# Altium schematic sheet Power_Sheet.SchDoc
size 420 x 297 mm; SheetNumber: 3; SheetTotal: 12
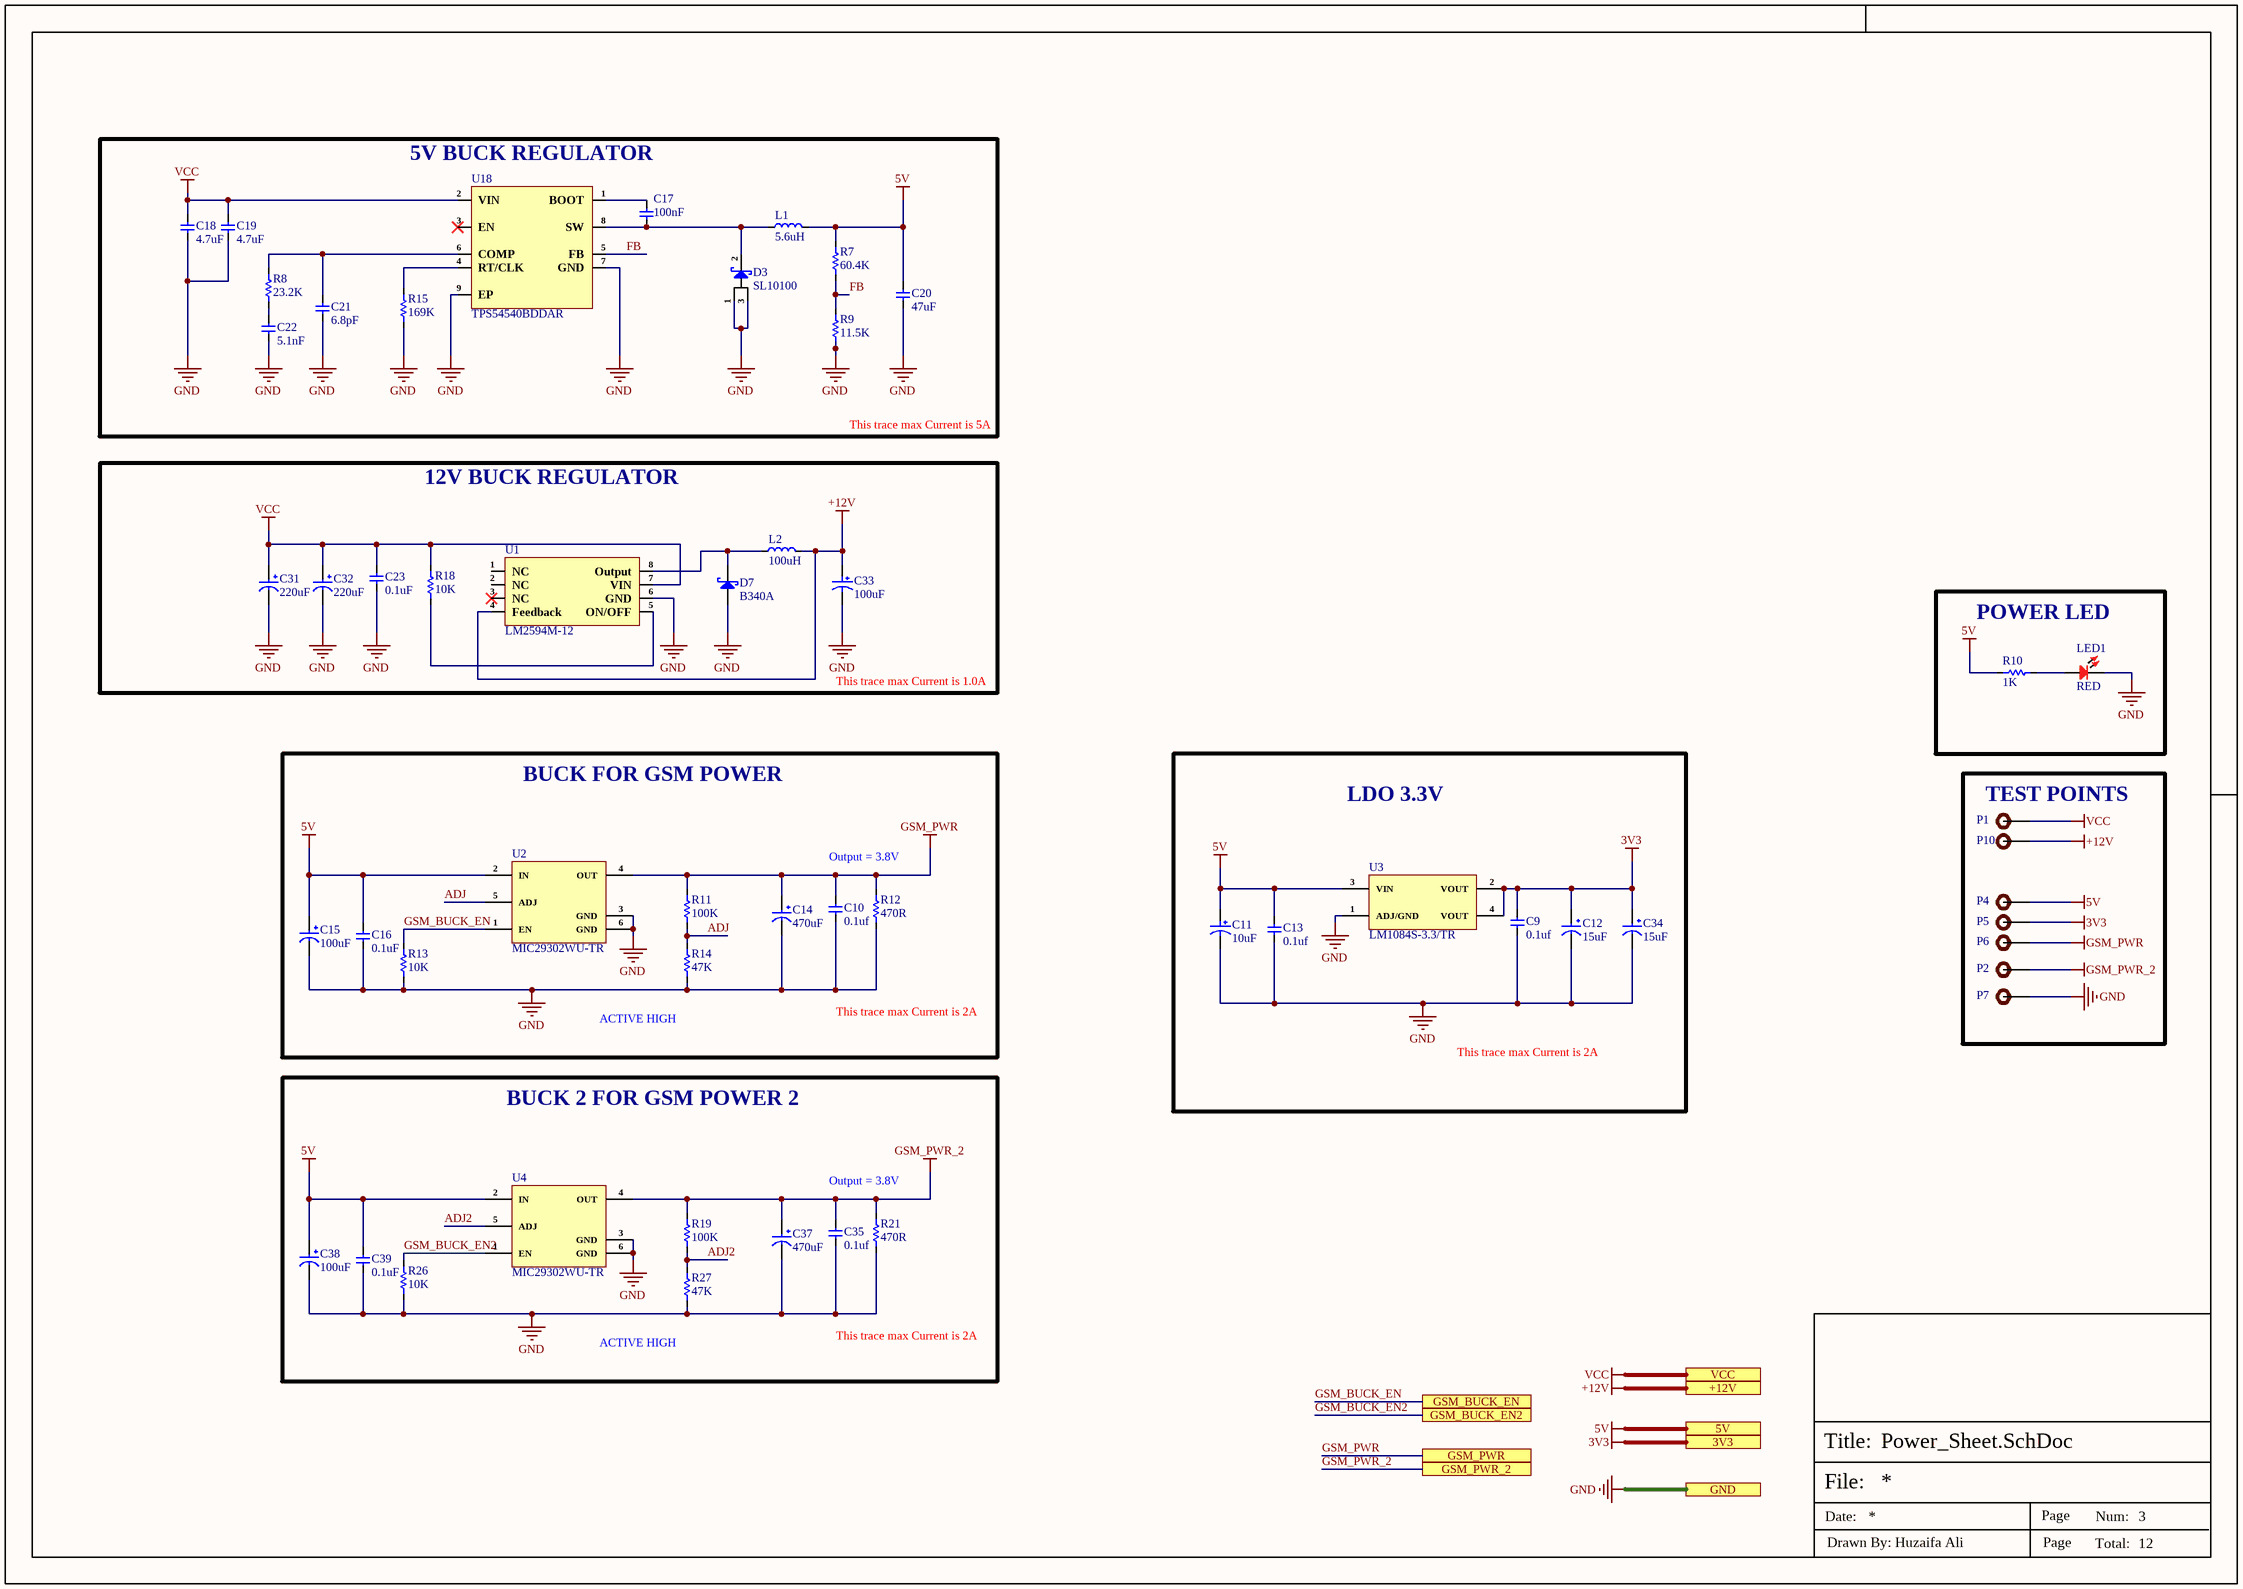
[diagram p0: Power_Sheet.SchDoc]

## Parts
C9  0.1uf  [Cap-0402]
C10  0.1uf  [Cap-0402]
C11  10uF  [Case-B]
C12  15uF  [Case-D]
C13  0.1uf  [Cap-0402]
C14  470uF  [Case-E]
C15  100uF  [Case-B]
C16  0.1uF  [Cap-0603]
C17  100nF  [Cap-0402]
C18  4.7uF  [Cap-1206]
C19  4.7uF  [Cap-1206]
C20  47uF  [Cap-1206]
C21  6.8pF  [Cap-0402]
C22  5.1nF  [Res-0603]
C23  0.1uF  [Cap-0603]
C31  220uF  [UCD-220uF-10mmDia]
C32  220uF  [UCD-220uF-10mmDia]
C33  100uF  [RVT1H101M0607]
C34  15uF  [Case-D]
C35  0.1uf  [Cap-0402]
C37  470uF  [Case-E]
C38  100uF  [Case-B]
C39  0.1uF  [Cap-0603]
D3  SL10100  [TO-277]
D7  B340A  [SMA(DO-214AC)]
L1  5.6uH  [FXL0630-5R6-M]
L2  100uH  [TMPA1265SP-101MN-D]
LED1  RED  [LED-0603]
P1  TEST POINT  [Test-point]  (value not drawn)  (no BOM)
P2  TEST POINT  [Test-point]  (value not drawn)  (no BOM)
P4  TEST POINT  [Test-point]  (value not drawn)  (no BOM)
P5  TEST POINT  [Test-point]  (value not drawn)  (no BOM)
P6  TEST POINT  [Test-point]  (value not drawn)  (no BOM)
P7  TEST POINT  [Test-point]  (value not drawn)  (no BOM)
P10  TEST POINT  [Test-point]  (value not drawn)  (no BOM)
R7  60.4K  [Res-0402]
R8  23.2K  [Res-0402]
R9  11.5K  [Res-0402]
R10  1K  [Res-0201]
R11  100K  [Res-0201]
R12  470R  [Res-0201]
R13  10K  [Res-0201]
R14  47K  [Res-0402]
R15  169K  [Res-0402]
R18  10K  [Res-0201]
R19  100K  [Res-0201]
R21  470R  [Res-0201]
R26  10K  [Res-0201]
R27  47K  [Res-0402]
U1  LM2594M-12  [SOP-8]
U2  MIC29302WU-TR  [TO-263-5 (D2PAK)]
U3  LM1084S-3.3/TR  [TO263-3_]
U4  MIC29302WU-TR  [TO-263-5 (D2PAK)]
U18  TPS54540BDDAR  [8-SO PowerPad]

## Blocks framed on the sheet
5V BUCK REGULATOR: C17-C22 D3 L1 R7-R9 R15 U18
12V BUCK REGULATOR: C23 C31-C33 D7 L2 R18 U1
POWER LED: LED1 R10
BUCK FOR GSM POWER: C10 C14-C16 R11-R14 U2
LDO 3.3V: C9 C11-C13 C34 U3
TEST POINTS: P1 P2 P4-P7 P10
BUCK 2 FOR GSM POWER 2: C35 C37-C39 R19 R21 R26 R27 U4

## Ports
3V3, 5V, +12V, GND, GSM_BUCK_EN, GSM_BUCK_EN2, GSM_PWR, GSM_PWR_2, VCC

## Nets
3V3: C9.2 C12.1 C34.1 P5.1 U3.2(VOUT) U3.4(VOUT) ; port 3V3
5V: C11.1 C13.2 C15.1 C16.2 C20.2 C38.1 C39.2 L1.2 P4.1 R7.2 R10.1 U2.2(IN) U3.3(VIN) U4.2(IN) ; port 5V
+12V: C33.1 L2.2 P10.1 U1.4(Feedback) ; port +12V
GND: C9.1 C10.1 C11.2 C12.2 C13.1 C14.2 C15.2 C16.1 C18.1 C19.1 C20.1 C21.1 C22.1 C23.1 C31.2 C32.2 C33.2 C34.2 C35.1 C37.2 C38.2 C39.1 D3.1(A) D3.3(A) D7.2(A) LED1.2 P7.1 R9.1 R12.1 R13.1 R14.1 R15.1 R21.1 R26.1 R27.1 U1.6(GND) U2.3(GND) U2.6(GND) U3.1(ADJ/GND) U4.3(GND) U4.6(GND) U18.7(GND) U18.9(EP) ; port GND
GSM_PWR: C10.2 C14.1 P6.1 R11.2 R12.2 U2.4(OUT) ; port GSM_PWR
GSM_PWR_2: C35.2 C37.1 P2.1 R19.2 R21.2 U4.4(OUT) ; port GSM_PWR_2
VCC: C18.2 C19.2 C23.2 C31.1 C32.1 P1.1 R18.2 U1.7(VIN) U18.2(VIN) ; port VCC
ADJ: R11.1 R14.2 U2.5(ADJ)
ADJ2: R19.1 R27.2 U4.5(ADJ)
FB: R7.1 R9.2 U18.5(FB)
GSM_BUCK_EN: R13.2 U2.1(EN) ; port GSM_BUCK_EN
GSM_BUCK_EN2: R26.2 U4.1(EN) ; port GSM_BUCK_EN2
NetC17_1: C17.1 D3.2(K) L1.1 U18.8(SW)
NetC17_2: C17.2 U18.1(BOOT)
NetC21_2: C21.2 R8.2 U18.6(COMP)
NetC22_2: C22.2 R8.1
NetD7_1: D7.1(K) L2.1 U1.8(Output)
NetLED1_1: LED1.1 R10.2
NetR15_2: R15.2 U18.4(RT/CLK)
NetR18_1: R18.1 U1.5(ON/OFF)

Not connected (* = marked no-connect by the designer): U1 1(NC) 2(NC) 3(NC)*; U18 3(EN)*

## Notes on the sheet
- This trace max Current is 5A
- This trace max Current is 1.0A
- Output = 3.8V
- (near R14) ACTIVE HIGH
- This trace max Current is 2A
- (near R27) ACTIVE HIGH
- File:
- Title:
- Date:
- Page
- Num:
- Total:
- Drawn By: Huzaifa Ali

## Library data of the parts
C9 C10 C13 C35 = GRM155R62A104KE14D: CAP CER 0.1UF 100V X5R 0402; Manufacturer: Murata; Capacitance: 100nF; Tolerance: 10%; Item Type: Capacitor; Supplier 1: Arrow Electronics; Manufacturer Part Number: GRM155R62A104KE14D; RoHS: Yes; Category: Ceramic Capacitors; Stock 1: 870000; Pricing 1: 10000=0.00500, 20000=0.00410, 30000=0.00390, 50000=0.00370, 100000=0.00300 (USD); Mount: Surface Mount; Case/Package: 0402; Case Code (Metric): 1005; Case Code (Imperial): 0402; Weight: 0.000212oz; Min Operating Temperature: -55°C; Max Operating Temperature: 85°C; Packaging: Tape and Reel; Voltage Rating: 100V; Dielectric: X5R; Termination: SMD/SMT; Voltage Rating (DC): 100V; Package Quantity: 10000; Series: GRM; Length: 0.039inch; Width: 0.02inch; Height: 0.5mm; Thickness: 0.022inch; Reach SVHC Compliant: Yes; Lead Free: Lead Free; RoHS Compliant: Yes; ComponentLink1URL: http://www.farnell.com/datasheets/2079151.pdf?src-supplier=Farnell; ComponentLink1Description: http://www.farnell.com/datasheets/2079151.pdf?src-supplier=Farnell; ComponentLink2URL: http://www.mouser.com/ds/2/281/c02e-2905.pdf?src-supplier=Mouser; ComponentLink2Description: http://www.mouser.com/ds/2/281/c02e-2905.pdf?src-supplier=Mouser; ComponentLink3URL: http://www.farnell.com/datasheets/2079151.pdf?src-supplier=Element14; ComponentLink3Description: http://www.farnell.com/datasheets/2079151.pdf?src-supplier=Element14; ComponentLink4URL: http://search.murata.co.jp/Ceramy/image/img/A01X/G101/ENG/GRM155R62A104KE14-01.pdf?src-supplier=Digi-Key; ComponentLink4Description: http://search.murata.co.jp/Ceramy/image/img/A01X/G101/ENG/GRM155R62A104KE14-01.pdf?src-supplier=Digi-Key; ComponentLink5URL: http://www.farnell.com/datasheets/2079151.pdf?src-supplier=Newark; ComponentLink5Description: http://www.farnell.com/datasheets/2079151.pdf?src-supplier=Newark; Supplier Part Number 1: GRM155R62A104KE14D; LCSC Part Number: C162178
C11 = CA45-B025K106T: 10uF 25V 2.5Ω@100kHz ±10% CASE-B-3528 Tantalum Capacitors ROHS; Manufacturer: Xiangyee in S&T; Manufacturer Part Number: CA45-B025K106T; ComponentLink1URL: https://www.lcsc.com/product-detail/Tantalum-Capacitors_Hunan-Xiangyee-in-S-T-CA45-B025K106T_C119050.html; ComponentLink1Description: LCSC; LCSC Part Number: C119050; Item Type: Capacitor; Package: Case-B
C12 C34 = TAJD156K050RNJ: CAP TANT 15UF 10% 50V 2917; Manufacturer: Kyocera AVX; Dielectric Material: Tantalum; ESR (Equivalent Series Resistance): 600mR; Leakage Current: 7.5uA; Dissipation Factor: 6%; Item Type: Capacitor; Supplier 1: Rs; Manufacturer Part Number: TAJD156K050RNJ; RoHS: Yes; Category: Tantalum Capacitors; Stock 1: 712; Pricing 1: 500=1.59 (GBP); Mounting Technology: Surface Mount; Case/Package: 2917; Case Code (Metric): 7343; Case Code (Imperial): 2917; Min Operating Temperature: -55°C; Max Operating Temperature: 125°C; Value: 15uF; Tolerance: 10%; Voltage Rating: 50V; Packaging: Tape and Reel; Package Quantity: 500; Termination: SMD/SMT; Features: General Purpose; Series: TAJ; Construction: Flat; Length: 7.3mm; Width: 4.3mm; Height: 3.1mm; Height - Seated (Max): 0.122inch; Depth: 4.3mm; Lead Pitch: 4.4mm; Radiation Hardening: No; Reach SVHC Compliant: No; Lead Free: Lead Free; RoHS Compliant: Yes; ComponentLink1URL: https://datasheet.ciiva.com/7914/1680476-7914621.pdf?src-supplier=Element14; ComponentLink1Description: https://datasheet.ciiva.com/7914/1680476-7914621.pdf?src-supplier=Element14; ComponentLink2URL: https://datasheet.ciiva.com/7914/1680476-7914620.pdf?src-supplier=Element14; ComponentLink2Description: https://datasheet.ciiva.com/7914/1680476-7914620.pdf?src-supplier=Element14; ComponentLink3URL: https://datasheet.ciiva.com/7914/1826076-7914622.pdf?src-supplier=Element14; ComponentLink3Description: https://datasheet.ciiva.com/7914/1826076-7914622.pdf?src-supplier=Element14; ComponentLink4URL: https://datasheet.ciiva.com/29500/taj-29500328.pdf?src-supplier=Digi-Key; ComponentLink4Description: https://datasheet.ciiva.com/29500/taj-29500328.pdf?src-supplier=Digi-Key; ComponentLink5URL: https://datasheet.ciiva.com/29500/taj-29500327.pdf?src-supplier=Digi-Key; ComponentLink5Description: https://datasheet.ciiva.com/29500/taj-29500327.pdf?src-supplier=Digi-Key; ComponentLink6URL: https://datasheet.ciiva.com/29500/taj-29500329.pdf?src-supplier=Digi-Key; ComponentLink6Description: https://datasheet.ciiva.com/29500/taj-29500329.pdf?src-supplier=Digi-Key; ComponentLink7URL: https://datasheet.ciiva.com/12884/taj-27497-12884462.pdf?src-supplier=Mouser; ComponentLink7Description: https://datasheet.ciiva.com/12884/taj-27497-12884462.pdf?src-supplier=Mouser; ComponentLink8URL: https://datasheet.ciiva.com/11229/taj-11229647.pdf?src-supplier=Avnet; ComponentLink8Description: https://datasheet.ciiva.com/11229/taj-11229647.pdf?src-supplier=Avnet; ComponentLink9URL: https://datasheet.ciiva.com/16492/taj-16492939.pdf?src-supplier=Future+Electronics; ComponentLink9Description: https://datasheet.ciiva.com/16492/taj-16492939.pdf?src-supplier=Future+Electronics; Supplier Part Number 1: 1360323; LCSC Part Number: C308932
C14 C37 = TAJE477K010RNJ: CAP TANT 470UF 10% 10V 2917; Manufacturer: Kyocera AVX; Dielectric Material: Tantalum; ESR (Equivalent Series Resistance): 500mR; Leakage Current: 47uA; Polarity: Polar; Item Type: Capacitor; Supplier 1: Arrow Electronics; Manufacturer Part Number: TAJE477K010RNJ; RoHS: Yes; Category: Tantalum Capacitors; Stock 1: 5; Pricing 1: 1=1.3181 (USD); Mounting Technology: Surface Mount,PCB; Case/Package: 2917; Pins: 2; Case Code (Imperial): 2917; Case Code (Metric): 7343; Min Operating Temperature: -55°C; Max Operating Temperature: 125°C; Value: 470uF; Tolerance: 10%; Packaging: Tape and Reel; Voltage Rating: 10V; Voltage Rating (DC): 10V; Package Quantity: 400; Termination: SMD/SMT; Voltage: 10V; Dissipation Factor: 10%; Features: General Purpose; Series: TAJ; Construction: Flat; Length: 7.3mm; Width: 4.3mm; Height: 4.1mm; Depth: 4.3mm; Lead Pitch: 4.4mm; Radiation Hardening: No; Reach SVHC Compliant: No; Lead Free: Lead Free; RoHS Compliant: Yes; ComponentLink1URL: https://datasheet.ciiva.com/7832/taj-7832508.pdf?src-supplier=Element14; ComponentLink1Description: https://datasheet.ciiva.com/7832/taj-7832508.pdf?src-supplier=Element14; ComponentLink2URL: https://datasheet.ciiva.com/7832/taj-7832507.pdf?src-supplier=Element14; ComponentLink2Description: https://datasheet.ciiva.com/7832/taj-7832507.pdf?src-supplier=Element14; ComponentLink3URL: https://datasheet.ciiva.com/265/taj-265547.pdf?src-supplier=Digi-Key; ComponentLink3Description: https://datasheet.ciiva.com/265/taj-265547.pdf?src-supplier=Digi-Key; ComponentLink4URL: https://datasheet.ciiva.com/265/taj-265546.pdf?src-supplier=Digi-Key; ComponentLink4Description: https://datasheet.ciiva.com/265/taj-265546.pdf?src-supplier=Digi-Key; ComponentLink5URL: https://datasheet.ciiva.com/265/taj-265548.pdf?src-supplier=Digi-Key; ComponentLink5Description: https://datasheet.ciiva.com/265/taj-265548.pdf?src-supplier=Digi-Key; ComponentLink6URL: https://datasheet.ciiva.com/12882/taj-27497-12882504.pdf?src-supplier=Mouser; ComponentLink6Description: https://datasheet.ciiva.com/12882/taj-27497-12882504.pdf?src-supplier=Mouser; ComponentLink7URL: https://datasheet.ciiva.com/14602/70001050-14602312.pdf?src-supplier=Allied+Electronics; ComponentLink7Description: https://datasheet.ciiva.com/14602/70001050-14602312.pdf?src-supplier=Allied+Electronics; ComponentLink8URL: https://datasheet.ciiva.com/14600/70001050-14600301.pdf?src-supplier=Allied+Electronics; ComponentLink8Description: https://datasheet.ciiva.com/14600/70001050-14600301.pdf?src-supplier=Allied+Electronics; ComponentLink9URL: https://datasheet.ciiva.com/11229/taj-11229470.pdf?src-supplier=Avnet; ComponentLink9Description: https://datasheet.ciiva.com/11229/taj-11229470.pdf?src-supplier=Avnet; ComponentLink10URL: https://datasheet.ciiva.com/16330/taj-16330918.pdf?src-supplier=Future+Electronics; ComponentLink10Description: https://datasheet.ciiva.com/16330/taj-16330918.pdf?src-supplier=Future+Electronics; Supplier Part Number 1: TAJE477K010RNJ; LCSC Part Number: C7234
C15 C38 = TAJB107M010RNJ: CAP TANT 100UF 20% 10V 1411; Manufacturer: Kyocera AVX; Dielectric Material: Tantalum; Tolerance: 10%; ESR (Equivalent Series Resistance): 1.4R; Leakage Current: 10uA; Dissipation Factor: 8%; Item Type: Capacitor; Supplier 1: Rs; Manufacturer Part Number: TAJB107M010RNJ; RoHS: Yes; Category: Tantalum Capacitors; Stock 1: 17520; Pricing 1: 2000=0.302 (GBP); Mounting Technology: Surface Mount; Case/Package: 1210; Case Code (Imperial): 1210; Case Code (Metric): 3528; Min Operating Temperature: -55°C; Max Operating Temperature: 125°C; Value: 100uF; Voltage Rating (DC): 10V; Series: TAJ; Construction: Flat; Voltage Rating: 10V; Package Quantity: 2000; Packaging: Tape and Reel; Termination: SMD/SMT; Voltage: 10V; Features: General Purpose; Length: 3.5mm; Width: 2.8mm; Height: 2.1mm; Depth: 2.8mm; Radiation Hardening: No; Lead Free: Lead Free; RoHS Compliant: Yes; Reach SVHC Compliant: No; ComponentLink1URL: https://datasheet.ciiva.com/264/taj-264281.pdf?src-supplier=Digi-Key; ComponentLink1Description: https://datasheet.ciiva.com/264/taj-264281.pdf?src-supplier=Digi-Key; ComponentLink2URL: https://datasheet.ciiva.com/264/taj-264280.pdf?src-supplier=Digi-Key; ComponentLink2Description: https://datasheet.ciiva.com/264/taj-264280.pdf?src-supplier=Digi-Key; ComponentLink3URL: https://datasheet.ciiva.com/264/taj-264282.pdf?src-supplier=Digi-Key; ComponentLink3Description: https://datasheet.ciiva.com/264/taj-264282.pdf?src-supplier=Digi-Key; ComponentLink4URL: https://datasheet.ciiva.com/11225/taj-11225964.pdf?src-supplier=Avnet; ComponentLink4Description: https://datasheet.ciiva.com/11225/taj-11225964.pdf?src-supplier=Avnet; ComponentLink5URL: https://datasheet.ciiva.com/11225/taj-11225963.pdf?src-supplier=Avnet; ComponentLink5Description: https://datasheet.ciiva.com/11225/taj-11225963.pdf?src-supplier=Avnet; Supplier Part Number 1: 1354069; LCSC Part Number: C7196
C16 C23 C39 = CC0603KRX7R0BB104: CAP CER 0.1UF 100V X7R 0603; Manufacturer: Yageo; Capacitance: 100nF; Tolerance: 10%; Item Type: Capacitor; Supplier 1: Digi-Key; Manufacturer Part Number: CC0603KRX7R0BB104; RoHS: Yes; Category: Ceramic Capacitors; Stock 1: 60476; Pricing 1: 1=0.19000, 10=0.13500, 50=0.07680, 100=0.06370, 500=0.04466, 1000=0.03696 (USD); Mount: Surface Mount; Case/Package: 0603; Case Code (Metric): 1608; Case Code (Imperial): 0603; Weight: 7.1E-05oz; Min Operating Temperature: -55°C; Max Operating Temperature: 125°C; Package Quantity: 4000; Voltage Rating: 100V; Packaging: Tape and Reel; Dielectric: X7R; Termination: SMD/SMT; Resistor Type: Ceramic; Voltage Rating (DC): 100V; Series: CC; Length: 0.063inch; Width: 0.031inch; Thickness: 0.035inch; Depth: 0.8mm; Lead Free: Lead Free; RoHS Compliant: Yes; ComponentLink1URL: https://datasheet.ciiva.com/6277/mlccorderingcode-6277030.pdf?src-supplier=Digi-Key; ComponentLink1Description: https://datasheet.ciiva.com/6277/mlccorderingcode-6277030.pdf?src-supplier=Digi-Key; ComponentLink2URL: https://datasheet.ciiva.com/6277/mlccorderingcode-6277081.pdf?src-supplier=Digi-Key; ComponentLink2Description: https://datasheet.ciiva.com/6277/mlccorderingcode-6277081.pdf?src-supplier=Digi-Key; ComponentLink3URL: https://datasheet.ciiva.com/6277/mlccorderingcode-6277082.pdf?src-supplier=Digi-Key; ComponentLink3Description: https://datasheet.ciiva.com/6277/mlccorderingcode-6277082.pdf?src-supplier=Digi-Key; Supplier Part Number 1: 311-1523-1-ND; LCSC Part Number: C113803
C17 = CC0402JRX7R9BB104: CAP 0402 50V 100 NF X7R; Manufacturer: Yageo; Dielectric: 1511DielectricType; Item Type: Capacitor; Supplier: Digi-Key; Supplier Part Number: 13-CC0402JRX7R9BB104TR-ND; Manufacturer Part Number: CC0402JRX7R9BB104; RoHS: No; Category: Ceramic Capacitors; Pricing: 10000=0.0157 (USD); Case/Package: 343Case; Value: 100nF; Voltage Rating (DC): 50V; Lead Free: 5697LeadFree; LCSC Part Number: C5182432
C18 C19 = GRM31CC72A475KE11L: CAP CER 4.7UF 100V X7S 1206; Manufacturer: Murata; Item Type: Capacitor; Supplier 1: Arrow Electronics; Manufacturer Part Number: GRM31CC72A475KE11L; RoHS: Yes; Category: Ceramic Capacitors; Stock 1: 120000; Pricing 1: 2000=0.23470, 4000=0.21710, 10000=0.21040, 14000=0.20560 (USD); RoHS Compliant: Yes; ComponentLink1URL: https://search.murata.co.jp/Ceramy/image/img/A01X/G101/ENG/GRM31CC72A475KE11-01A.pdf?src-supplier=Digi-Key; ComponentLink1Description: https://search.murata.co.jp/Ceramy/image/img/A01X/G101/ENG/GRM31CC72A475KE11-01A.pdf?src-supplier=Digi-Key; Supplier Part Number 1: GRM31CC72A475KE11L; LCSC Part Number: C237304
C20 = GRM31CR61E476ME44L: CAP CER 47UF 25V X5R 1206; Manufacturer: Murata; Tolerance: 20%; Item Type: Capacitor; Supplier 1: Digi-Key; Manufacturer Part Number: GRM31CR61E476ME44L; RoHS: Yes; Category: Ceramic Capacitors; Capacitance: 47uF; Voltage Rating (DC): 25V; Dielectric: X5R; Length: 3.2mm; Width: 1.6mm; Thickness: 1.6mm; ComponentLink1URL: https://search.murata.co.jp/Ceramy/image/img/A01X/partnumbering_e_01.pdf?src-supplier=Digi-Key; ComponentLink1Description: https://search.murata.co.jp/Ceramy/image/img/A01X/partnumbering_e_01.pdf?src-supplier=Digi-Key; Supplier Part Number 1: 490-16268-2-ND; LCSC Part Number: C403725
C21 = CC0402CRNPO9BN6R8: CAP CER 6.8PF 50V C0G/NPO 0402; Manufacturer: Yageo; Dielectric: C0G; Tolerance: 2%; Insulation Resistance: 10GR; Item Type: Capacitor; Supplier: Future Electronics; Supplier Part Number: 3247368; Manufacturer Part Number: CC0402CRNPO9BN6R8; RoHS: Yes; Category: Ceramic Capacitors; Stock: 200000; Pricing: 10000=0.0024, 40000=0.0022, 150000=0.0021, 400000=0.002, 1000000=0.0019 (USD); Mounting Technology: Surface Mount; Case/Package: 0402; Case Code (Imperial): 0402; Case Code (Metric): 1005; Weight: 2.3E-05oz; Min Operating Temperature: -55°C; Max Operating Temperature: 125°C; Value: 6.8pF; Packaging: Tape and Reel; Voltage Rating: 50V; Voltage Rating (DC): 50V; Termination: SMD/SMT; Series: CC; Construction: Flat; Length: 1mm; Width: 0.5mm; Height: 0.5mm; Depth: 0.5mm; Radiation Hardening: No; RoHS Compliant: Yes; ComponentLink1URL: https://datasheet.ciiva.com/11587/upy-gp-np0-16v-to-50v-8-11587182.pdf?src-supplier=Avnet; ComponentLink1Description: https://datasheet.ciiva.com/11587/upy-gp-np0-16v-to-50v-8-11587182.pdf?src-supplier=Avnet; LCSC Part Number: C189470
C22 = TCC0603X7R512K500CT: 5.1nF 50V X7R ±10% 0603 Multilayer Ceramic Capacitors MLCC - SMD/SMT ROHS; Manufacturer: CCTC; Manufacturer Part Number: TCC0603X7R512K500CT; Package: 0603; LCSC Part Number: C5360792; Item Type: Capacitor; ComponentLink1Description: LCSC; ComponentLink1URL: https://www.lcsc.com/product-detail/Multilayer-Ceramic-Capacitors-MLCC-SMD-SMT_CCTC-TCC0603X7R512K500CT_C5360792.html
C31 C32 = UCD1H221MNL1GS: CAP ALUM 220UF 20% 50V SMD; Manufacturer: Nichicon; Ripple Current: 700mA; Impedance: 160mR; Leakage Current: 3uA; Life (Hours): 5000Hour; Dissipation Factor: 0.1%; Item Type: Capacitor; Supplier 1: Digi-Key; Manufacturer Part Number: UCD1H221MNL1GS; RoHS: Yes; Category: Aluminum Electrolytic Capacitors; Pricing 1: 1=0.85000, 10=0.60200, 50=0.45480, 100=0.39620 (USD); Mount: Surface Mount,PCB; Case/Package: Radial; Min Operating Temperature: -55°C; Max Operating Temperature: 105°C; Capacitance: 220uF; Tolerance: 20%; Voltage Rating: 50V; Packaging: Tape and Reel; Package Quantity: 1; Voltage Rating (DC): 50V; Termination: SMD/SMT; Voltage: 50V; Features: General Purpose; Series: CD; Construction: Cylindrical; Diameter: 10mm; Length: 10mm; Height: 10mm; Height - Seated (Max): 0.394inch; Radiation Hardening: No; Lead Free: Lead Free; RoHS Compliant: Yes; ComponentLink1URL: https://datasheet.ciiva.com/11776/0900766b80ebdadd-11776792.pdf?src-supplier=RSComponents; ComponentLink1Description: https://datasheet.ciiva.com/11776/0900766b80ebdadd-11776792.pdf?src-supplier=RSComponents; ComponentLink2URL: https://datasheet.ciiva.com/5362/e-cd-22158-5362489.pdf?src-supplier=Mouser; ComponentLink2Description: https://datasheet.ciiva.com/5362/e-cd-22158-5362489.pdf?src-supplier=Mouser; ComponentLink3URL: https://datasheet.ciiva.com/11684/e-cd-11684678.pdf?src-supplier=Avnet; ComponentLink3Description: https://datasheet.ciiva.com/11684/e-cd-11684678.pdf?src-supplier=Avnet; ComponentLink4URL: https://datasheet.ciiva.com/15037/e-cd-15037119.pdf?src-supplier=Digi-Key; ComponentLink4Description: https://datasheet.ciiva.com/15037/e-cd-15037119.pdf?src-supplier=Digi-Key; ComponentLink5URL: https://datasheet.ciiva.com/16393/e-cd-16393493.pdf?src-supplier=Future+Electronics; ComponentLink5Description: https://datasheet.ciiva.com/16393/e-cd-16393493.pdf?src-supplier=Future+Electronics; ComponentLink6URL: https://datasheet.ciiva.com/17354/e-cd-17354606.pdf?src-supplier=Avnet+Europe; ComponentLink6Description: https://datasheet.ciiva.com/17354/e-cd-17354606.pdf?src-supplier=Avnet+Europe; Supplier Part Number 1: 493-6390-1-ND; LCSC Part Number: C116211
C33 = RVT1H101M0607: 100uF 50V ±20% SMD,D6.3xL7.7mm Aluminum Electrolytic Capacitors - SMD ROHS; Manufacturer: ROQANG; Manufacturer Part Number: RVT1H101M0607; Package: SMD,D6.3xL7.7mm; LCSC Part Number: C3151829; Item Type: Capacitor; ComponentLink1Description: LCSC; ComponentLink1URL: https://www.lcsc.com/product-detail/Aluminum-Electrolytic-Capacitors-SMD_ROQANG-RVT1H101M0607_C3151829.html
D3 = SL10100: 100V Dual Common Cathode 10A 670mV@10A TO-277 Schottky Barrier Diodes (SBD) ROHS; Manufacturer: GOODWORK; Item Type: Diode; Manufacturer Part Number: SL10100; Package: TO-277; LCSC Part Number: C2903949; ComponentLink1Description: LCSC; ComponentLink1URL: https://www.lcsc.com/product-detail/Schottky-Barrier-Diodes-SBD_GOODWORK-SL10100_C2903949.html
D7 = B340A: 40V 3A 550mV@3A SMA(DO-214AC) Schottky Barrier Diodes (SBD) ROHS; Manufacturer: FUXINSEMI; Item Type: Diode; Manufacturer Part Number: B340A; Package: SMA(DO-214AC); LCSC Part Number: C3018525; ComponentLink1Description: LCSC; ComponentLink1URL: https://www.lcsc.com/product-detail/Schottky-Barrier-Diodes-SBD_FUXINSEMI-B340A_C3018525.html
L1 = FXL0630-5R6-M: 5.5A 5.6uH Molding Choke ±20% 6.5A SMD,6.6x7mm Power Inductors ROHS; Manufacturer: cjiang; Manufacturer Part Number: FXL0630-5R6-M; Package: SMD,6.6x7mm; LCSC Part Number: C475914; Item Type: Inductor; ComponentLink1Description: LCSC; ComponentLink1URL: https://www.lcsc.com/product-detail/Power-Inductors_cjiang-Changjiang-Microelectronics-Tech-FXL0630-5R6-M_C475914.html
L2 = TMPA1265SP-101MN-D: 3.8A 100uH ±20% SMD,12.6x13.5mm Power Inductors ROHS; Manufacturer: TAI-TECH; Manufacturer Part Number: TMPA1265SP-101MN-D; Package: SMD,12.6x13.5mm; LCSC Part Number: C357118; Item Type: Inductor; ComponentLink1Description: LCSC; ComponentLink1URL: https://www.lcsc.com/product-detail/Power-Inductors_TAI-TECH-TMPA1265SP-101MN-D_C357118.html
LED1 = NCD0603R3: RED LED 0603 Light Emitting Diodes; Manufacturer: Foshan NationStar Optoelectronics; Manufacturer Part Number: NCD0603R3; Package: 0603; Item Type: LED; LCSC Part Number: C3151730; ComponentLink1Description: LCSC; ComponentLink1URL: https://www.lcsc.com/product-detail/Light-Emitting-Diodes-LED_Foshan-NationStar-Optoelectronics-NCD0603R3_C3151730.html
P1 P2 P4-P7 P10 = TEST POINT: Test Point ON; Item Type: TEST POINT
R7 = SCR0402F60K4: 60.4kΩ 50V 62.5mW Thick Film Resistors ±1% 0402 Chip Resistor - Surface Mount ROHS; Manufacturer: VO; Manufacturer Part Number: SCR0402F60K4; Package: 0402; LCSC Part Number: C3016055; Item Type: Resistor; ComponentLink1Description: LCSC; ComponentLink1URL: https://www.lcsc.com/product-detail/Chip-Resistor-Surface-Mount_VO-SCR0402F60K4_C3016055.html
R8 = RC-02W2322FT: 62.5mW Thick Film Resistors 50V ±1% ±200ppm/℃ 23.2kΩ 0402 Chip Resistor - Surface Mount ROHS; Manufacturer: FH; Manufacturer Part Number: RC-02W2322FT; Package: 0402; LCSC Part Number: C321384; Item Type: Resistor; ComponentLink1Description: JLCPCB; ComponentLink1URL: https://jlcpcb.com/partdetail/302289-RC02W2322FT/C321384
R9 = FRC0402F1152TS: 11.5kΩ 50V 62.5mW Thick Film Resistors ±100ppm/℃ ±1%  0402 Chip Resistor - Surface Mount ROHS; Manufacturer: FOJAN; Manufacturer Part Number: FRC0402F1152TS; Package: 0402; LCSC Part Number: C2933068; Item Type: Resistor; ComponentLink1Description: LCSC; ComponentLink1URL: https://www.lcsc.com/product-detail/Chip-Resistor-Surface-Mount_FOJAN-FRC0402F1152TS_C2933068.html
R10 = RC0201FR-071KL: RES 1K OHM 1% 1/20W 0201; Manufacturer: Yageo; Value: 1kR; Temperature Coefficient: 200ppm/°C; Power Rating: 50mW; Voltage Rating: 25V; Item Type: Resistor; Supplier: Digi-Key; Supplier Part Number: 311-1KMCT-ND; Manufacturer Part Number: RC0201FR-071KL; RoHS: Yes; Category: Chip SMD Resistors; Stock: 5606340; Pricing: 1=0.1, 10=0.027, 50=0.0172, 100=0.0143, 500=0.00988, 1000=0.00854, 5000=0.00629 (USD); Case/Package: 0201; Contact Plating: Tin,Matte; Case Code (Metric): 0603; Case Code (Imperial): 0201; Min Operating Temperature: -55°C; Max Operating Temperature: 125°C; Tolerance: 1%; Resistor Type: Thick Film; Package Quantity: 10000; Packaging: Tape and Reel; Number of Terminations: 2; Termination: SMD/SMT; Max Power Dissipation: 50mW; Working Voltage: 25V; Features: Moisture Resistant; Series: RC; Resistance Tolerance: 1%; Technology: THICK FILM; Construction: Rectangular; Voltage Rating (DC): 25V; Length: 0.024inch; Width: 0.012inch; Height: 0.01inch; Depth: 0.3mm; Military Standard: Not; RoHS Compliant: Yes; Reach SVHC Compliant: Unknown; Lead Free: 5697LeadFree; ComponentLink1URL: https://datasheet.ciiva.com/7672/1563626-7672204.pdf?src-supplier=Element14; ComponentLink1Description: https://datasheet.ciiva.com/7672/1563626-7672204.pdf?src-supplier=Element14; ComponentLink2URL: https://datasheet.ciiva.com/22698/1563626-22698505.pdf?src-supplier=Element14; ComponentLink2Description: https://datasheet.ciiva.com/22698/1563626-22698505.pdf?src-supplier=Element14; ComponentLink3URL: https://datasheet.ciiva.com/29721/pyu-r-int-thick-7-29721196.pdf?src-supplier=Digi-Key; ComponentLink3Description: https://datasheet.ciiva.com/29721/pyu-r-int-thick-7-29721196.pdf?src-supplier=Digi-Key; ComponentLink4URL: https://datasheet.ciiva.com/29721/pyu-r-int-thick-7-29721195.pdf?src-supplier=Digi-Key; ComponentLink4Description: https://datasheet.ciiva.com/29721/pyu-r-int-thick-7-29721195.pdf?src-supplier=Digi-Key; ComponentLink5URL: https://datasheet.ciiva.com/8896/pyu-rc0201-51-rohs-l-8-8896174.pdf?src-supplier=Avnet; ComponentLink5Description: https://datasheet.ciiva.com/8896/pyu-rc0201-51-rohs-l-8-8896174.pdf?src-supplier=Avnet; LCSC Part Number: C138165
R11 R19 = RC0201JR-07100KL: RES SMD 100K OHM 5% 1/20W 0201; Manufacturer: Yageo; Resistance: 100kR; Temperature Coefficient: 200ppm/°C; Power Rating: 50mW; Voltage Rating: 25V; Supplier 1: Arrow Electronics; Manufacturer Part Number: RC0201JR-07100KL; RoHS: Yes; Category: Chip SMD Resistors; Stock 1: 76; Pricing 1: 1=0.09240, 10=0.09140, 25=0.05450, 10000=0.00340, 100000=0.00320, 1000000=0.00180, 5000000=0.00110 (USD); Case/Package: 0201; Contact Plating: Tin,Matte; Case Code (Metric): 0603; Case Code (Imperial): 0201; Weight: 6E-06oz; Size Code: 0201; Min Operating Temperature: -55°C; Max Operating Temperature: 125°C; Tolerance: 5%; Resistor Type: Thick Film; Package Quantity: 1; Packaging: Tape and Reel; Number of Terminations: 2; Termination: SMD/SMT; Max Power Dissipation: 50mW; Voltage Rating (DC): 25V; Features: Moisture Resistant; Series: RC; Resistance Tolerance: 5%; Construction: Rectangular; Length: 0.6mm; Width: 0.012inch; Height: 0.01inch; Depth: 0.3mm; Radiation Hardening: No; REACH SVHC: No SVHC; Military Standard: Not; Lead Free: Lead Free; RoHS Compliant: Yes; ComponentLink1URL: https://datasheet.ciiva.com/2462/pyu-r-int-thick-7-2462817.pdf?src-supplier=Digi-Key; ComponentLink1Description: https://datasheet.ciiva.com/2462/pyu-r-int-thick-7-2462817.pdf?src-supplier=Digi-Key; ComponentLink2URL: https://datasheet.ciiva.com/2462/pyu-r-int-thick-7-2462818.pdf?src-supplier=Digi-Key; ComponentLink2Description: https://datasheet.ciiva.com/2462/pyu-r-int-thick-7-2462818.pdf?src-supplier=Digi-Key; ComponentLink3URL: https://datasheet.ciiva.com/2462/pyu-r-int-thick-7-2462819.pdf?src-supplier=Digi-Key; ComponentLink3Description: https://datasheet.ciiva.com/2462/pyu-r-int-thick-7-2462819.pdf?src-supplier=Digi-Key; ComponentLink4URL: https://datasheet.ciiva.com/8888/pyu-rc0201-51-rohs-l-8-8888005.pdf?src-supplier=Avnet; ComponentLink4Description: https://datasheet.ciiva.com/8888/pyu-rc0201-51-rohs-l-8-8888005.pdf?src-supplier=Avnet; ComponentLink5URL: https://datasheet.ciiva.com/8896/pyu-rc0201-51-rohs-l-8-8896213.pdf?src-supplier=Avnet; ComponentLink5Description: https://datasheet.ciiva.com/8896/pyu-rc0201-51-rohs-l-8-8896213.pdf?src-supplier=Avnet; ComponentLink6URL: https://datasheet.ciiva.com/28395/pyu-rc0201-51-rohs-l-8-28395542.pdf?src-supplier=Avnet+Europe; ComponentLink6Description: https://datasheet.ciiva.com/28395/pyu-rc0201-51-rohs-l-8-28395542.pdf?src-supplier=Avnet+Europe; ComponentLink7URL: https://datasheet.ciiva.com/28639/1421516-28639863.pdf?src-supplier=Element14; ComponentLink7Description: https://datasheet.ciiva.com/28639/1421516-28639863.pdf?src-supplier=Element14; ComponentLink8URL: https://datasheet.ciiva.com/7672/1563626-7672249.pdf?src-supplier=Element14; ComponentLink8Description: https://datasheet.ciiva.com/7672/1563626-7672249.pdf?src-supplier=Element14; ComponentLink9URL: https://datasheet.ciiva.com/7672/1563626-7672250.pdf?src-supplier=Element14; ComponentLink9Description: https://datasheet.ciiva.com/7672/1563626-7672250.pdf?src-supplier=Element14; Supplier Part Number 1: RC0201JR-07100KL; LCSC Part Number: C106230
R12 R21 = RC-01W471JT: 50mW ±5% ±200ppm/℃ 470Ω 0201 Chip Resistor - Surface Mount ROHS; Manufacturer: FH; Manufacturer Part Number: RC-01W471JT; Package: 0201; LCSC Part Number: C304545; Item Type: Resistor; ComponentLink1Description: LCSC; ComponentLink1URL: https://www.lcsc.com/product-detail/Chip-Resistor-Surface-Mount_FH-Guangdong-Fenghua-Advanced-Tech-RC-01W471JT_C304545.html
R13 R18 R26 = RC0201FR-0710KL: RES SMD 10K OHM 1% 1/20W 0201; Manufacturer: Yageo; Item Type: Resistor; Manufacturer Part Number: RC0201FR-0710KL; Package: 0201; ComponentLink7Description: LCSC; ComponentLink7URL: https://www.lcsc.com/product-detail/Chip-Resistor-Surface-Mount_YAGEO-RC0201FR-0710KL_C106225.html; LCSC Part Number: C106225
R14 R27 = RC0402FR-0747KL: RES 47K OHM 1% 1/16W 0402; Manufacturer: Yageo; Power Rating: 62.5mW; Temperature Coefficient: 100ppm/°C; Voltage Rating: 50V; Resistance: 47kR; Max Power Dissipation: 63mW; Item Type: Resistor; Supplier 1: Avnet; Manufacturer Part Number: RC0402FR-0747KL; RoHS: Yes; Category: Chip SMD Resistors; Stock 1: 680000; Pricing 1: 10000=0.00085, 20000=0.00087, 40000=0.00084, 60000=0.00083, 80000=0.00079, 100000=0.00078, 1000000=0.00076 (USD); Case/Package: 0402; Case Code (Imperial): 0402; Case Code (Metric): 1005; Size Code: 0402; Min Operating Temperature: -55°C; Max Operating Temperature: 155°C; Tolerance: 1%; Series: RC; Packaging: Tape and Reel; Package Quantity: 1; Termination: SMD/SMT; Resistor Type: Thick Film; Number of Terminations: 2; Features: Moisture Resistant; Resistance Tolerance: 1%; Construction: Rectangular; Length: 1mm; Width: 0.02inch; Height: 0.016inch; Depth: 0.5mm; RoHS Compliant: Yes; Military Standard: Not; Lead Free: Lead Free; ComponentLink1URL: https://datasheet.ciiva.com/46412/1018594-46412839.pdf?src-supplier=Element14; ComponentLink1Description: https://datasheet.ciiva.com/46412/1018594-46412839.pdf?src-supplier=Element14; ComponentLink2URL: https://datasheet.ciiva.com/2453/pyu-r-int-thick-7-2453389.pdf?src-supplier=Digi-Key; ComponentLink2Description: https://datasheet.ciiva.com/2453/pyu-r-int-thick-7-2453389.pdf?src-supplier=Digi-Key; ComponentLink3URL: https://datasheet.ciiva.com/2453/pyu-r-int-thick-7-2453390.pdf?src-supplier=Digi-Key; ComponentLink3Description: https://datasheet.ciiva.com/2453/pyu-r-int-thick-7-2453390.pdf?src-supplier=Digi-Key; ComponentLink4URL: https://datasheet.ciiva.com/2453/pyu-r-int-thick-7-2453388.pdf?src-supplier=Digi-Key; ComponentLink4Description: https://datasheet.ciiva.com/2453/pyu-r-int-thick-7-2453388.pdf?src-supplier=Digi-Key; ComponentLink5URL: https://datasheet.ciiva.com/15189/getdatasheetpartid-323748-15189466.pdf?src-supplier=Verical; ComponentLink5Description: https://datasheet.ciiva.com/15189/getdatasheetpartid-323748-15189466.pdf?src-supplier=Verical; ComponentLink6URL: https://datasheet.ciiva.com/16793/pyu-rc0402-51-rohs-l-6-r-16793430.pdf?src-supplier=Future+Electronics; ComponentLink6Description: https://datasheet.ciiva.com/16793/pyu-rc0402-51-rohs-l-6-r-16793430.pdf?src-supplier=Future+Electronics; Supplier Part Number 1: RC0402FR-0747KL; LCSC Part Number: C93943
R15 = FRC0402F1693TS: 169kΩ 62.5mW Thick Film Resistors 50V ±100ppm/℃ ±1% 0402 Chip Resistor - Surface Mount ROHS; Manufacturer: FOJAN; Manufacturer Part Number: FRC0402F1693TS; Package: 0402; LCSC Part Number: C2974012; Item Type: Resistor; ComponentLink1Description: LCSC; ComponentLink1URL: https://www.lcsc.com/product-detail/Chip-Resistor-Surface-Mount_FOJAN-FRC0402F1693TS_C2974012.html
U1 = LM2594M-12: Step-down type Fixed 12V 4.5V~40V 1.5A SOP-8 DC-DC Converters ROHS; Manufacturer: UMW(Youtai Semiconductor Co., Ltd.); Item Type: IC; Manufacturer Part Number: LM2594M-12; Package: SOP-8; LCSC Part Number: C3029050; ComponentLink1Description: LCSC; ComponentLink1URL: https://www.lcsc.com/product-detail/DC-DC-Converters_UMW-Youtai-Semiconductor-Co-Ltd-LM2594M-12_C3029050.html
U2 U4 = MIC29302WU-TR: IC REG LDO ADJ 3A TO263-5; Manufacturer: Microchip; Output Voltage: 26V; Dropout Voltage: 370mV; Number of Regulators: 1; Min Input Voltage: 2.5V; Min Output Voltage: 1.25V; Max Output Voltage: 25V; Output Type: Adjustable; Output Configuration: Positive; Input Bias Current: 40nA; Reference Voltage: 1.24V; Quiescent Current: 35mA; Accuracy: 1%; Supplier 1: Future Electronics; Manufacturer Part Number: MIC29302WU-TR; RoHS: Yes; Category: Voltage Regulators - Linear; Pricing 1: 750=2.12000, 1500=2.09000, 2250=2.07000, 3000=2.06000, 3750=2.02000 (USD); Mount: Surface Mount; Case/Package: TO-263; Number of Pins: 5; Min Operating Temperature: -40°C; Max Operating Temperature: 125°C; Packaging: Tape and Reel; Package Quantity: 750; Series: -; Output Current: 3A; Max Input Voltage: 26V; Polarity: Positive; Number of Outputs: 1; Max Output Current: 3A; Length: 10.67mm; Width: 9.17mm; Height: 4.59mm; Radiation Hardening: No; Reach SVHC Compliant: Yes; RoHS Compliant: Yes; Lead Free: Lead Free; ComponentLink1URL: https://datasheet.ciiva.com/23772/1572633-23772885.pdf?src-supplier=Newark; ComponentLink1Description: https://datasheet.ciiva.com/23772/1572633-23772885.pdf?src-supplier=Newark; ComponentLink2URL: https://datasheet.ciiva.com/16296/mic29150-16296190.pdf?src-supplier=Future+Electronics; ComponentLink2Description: https://datasheet.ciiva.com/16296/mic29150-16296190.pdf?src-supplier=Future+Electronics; ComponentLink3URL: https://datasheet.ciiva.com/15200/getdatasheetpartid-143209-15200663.pdf?src-supplier=Verical; ComponentLink3Description: https://datasheet.ciiva.com/15200/getdatasheetpartid-143209-15200663.pdf?src-supplier=Verical; Supplier Part Number 1: 3153683; LCSC Part Number: C11149; Item Type: IC
U3 = LM1084S-3.3/TR: 72dB@(120Hz) 5A Fixed 3.3V~3.3V Positive 12V TO-263-3 Linear Voltage Regulators (LDO) ROHS; Manufacturer: HGSEMI; Item Type: IC; Manufacturer Part Number: LM1084S-3.3/TR; Package: TO-263-3; LCSC Part Number: C259972; ComponentLink1Description: LCSC; ComponentLink1URL: https://www.lcsc.com/product-detail/Linear-Voltage-Regulators-LDO_HGSEMI-LM1084S-3-3-TR_C259972.html
U18 = TPS54540BDDAR: IC REG BCK SPLIT RL ADJ 8SOPWR; Manufacturer: Texas Instruments; Manufacturer Part Number: TPS54540BDDAR; Package: SO-8; LCSC Part Number: C1850368; Item Type: IC; ComponentLink1Description: LCSC; ComponentLink1URL: https://www.lcsc.com/product-detail/DC-DC-Converters_Texas-Instruments-TPS54540BDDAR_C1850368.html